# EAGLE design dmxbox (EAGLE 9.6.2)
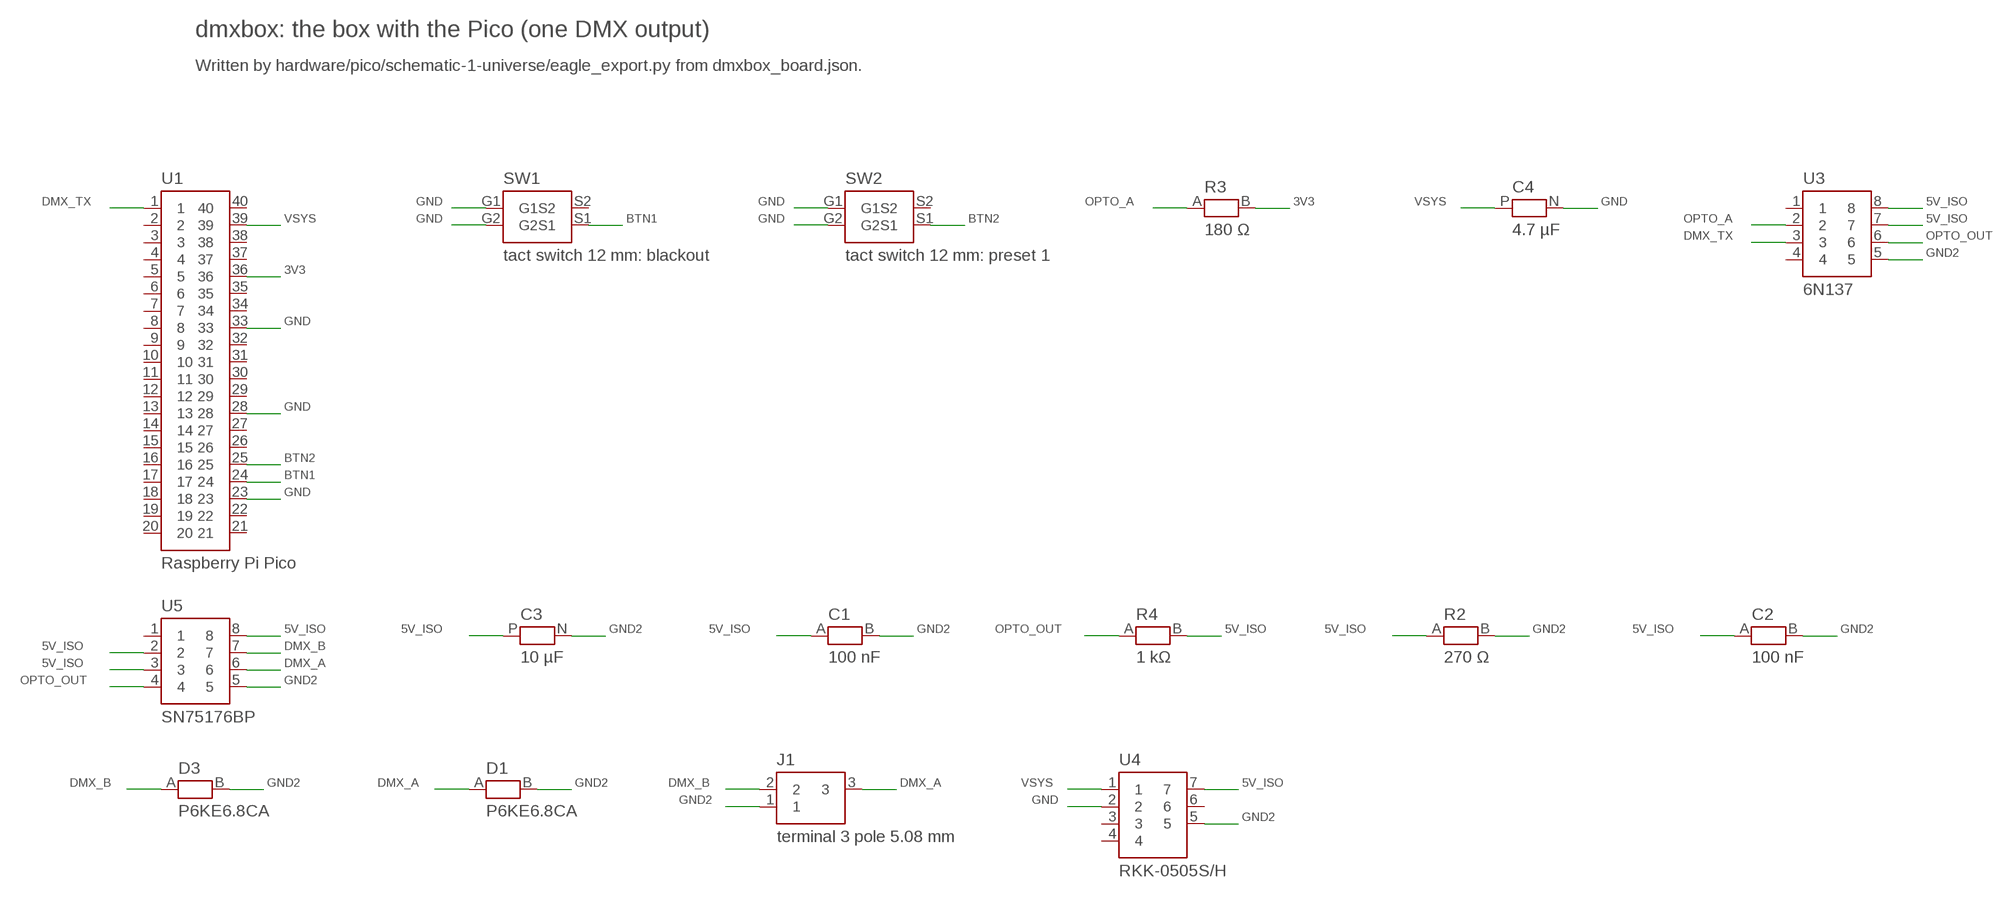
[diagram p0: schematic, sheet 1]

## Parts
C1  100 nF  C_5.00  [C_5.00]
C2  100 nF  C_5.00  [C_5.00]
C3  10 µF  CP_2.00  [CP_2.00]
C4  4.7 µF  CP_2.00  [CP_2.00]
D1  P6KE6.8CA  DO15_10.16  [DO15_10.16]
D3  P6KE6.8CA  DO15_10.16  [DO15_10.16]
J1  terminal 3 pole 5.08 mm  TERMINAL_3  [TERMINAL_3]
R2  270 Ω  R_10.16  [R_10.16]
R3  180 Ω  R_10.16  [R_10.16]
R4  1 kΩ  R_10.16  [R_10.16]
SW1  tact switch 12 mm: blackout  BUTTON_12MM  [BUTTON_12MM]
SW2  tact switch 12 mm: preset 1  BUTTON_12MM  [BUTTON_12MM]
U1  Raspberry Pi Pico  PICO  [PICO]
U3  6N137  [6N137]
U4  RKK-0505S/H  RKK_SIP7  [RKK_SIP7]
U5  SN75176BP  SN75176  [SN75176]

## Nets
3V3: R3.B U1.36
5V_ISO: C1.A C2.A C3.P R2.A R4.B U3.7 U3.8 U4.7 U5.2 U5.3 U5.8
BTN1: SW1.S1 U1.24
BTN2: SW2.S1 U1.25
DMX_A: D1.A J1.3 U5.6
DMX_B: D3.A J1.2 U5.7
DMX_TX: U1.1 U3.3
GND: C4.N SW1.G1 SW1.G2 SW2.G1 SW2.G2 U1.23 U1.28 U1.33 U4.2
GND2: C1.B C2.B C3.N D1.B D3.B J1.1 R2.B U3.5 U4.5 U5.5
OPTO_A: R3.A U3.2
OPTO_OUT: R4.A U3.6 U5.4
VSYS: C4.P U1.39 U4.1
Unconnected: SW1.S2 SW2.S2 U1.2 U1.3 U1.4 U1.5 U1.6 U1.7 U1.8 U1.9 U1.10 U1.11 U1.12 U1.13 U1.14 U1.15 U1.16 U1.17 U1.18 U1.19 U1.20 U1.21 U1.22 U1.26 U1.27 U1.29 U1.30 U1.31 U1.32 U1.34 U1.35 U1.37 U1.38 U1.40 U3.1 U3.4 U4.3 U4.4 U4.6 U5.1

## Notes on the sheet
- dmxbox: the box with the Pico (one DMX output)
- Written by hardware/pico/schematic-1-universe/eagle_export.py from dmxbox_board.json.

## Library data of the parts
C1 C2 = lumenet:C_5.00
C3 C4 = lumenet:CP_2.00
D1 D3 = lumenet:DO15_10.16
J1 = lumenet:TERMINAL_3
R2-R4 = lumenet:R_10.16
SW1 SW2 = lumenet:BUTTON_12MM
U1 = lumenet:PICO
U3 = lumenet:6N137
U4 = lumenet:RKK_SIP7
U5 = lumenet:SN75176

## Board
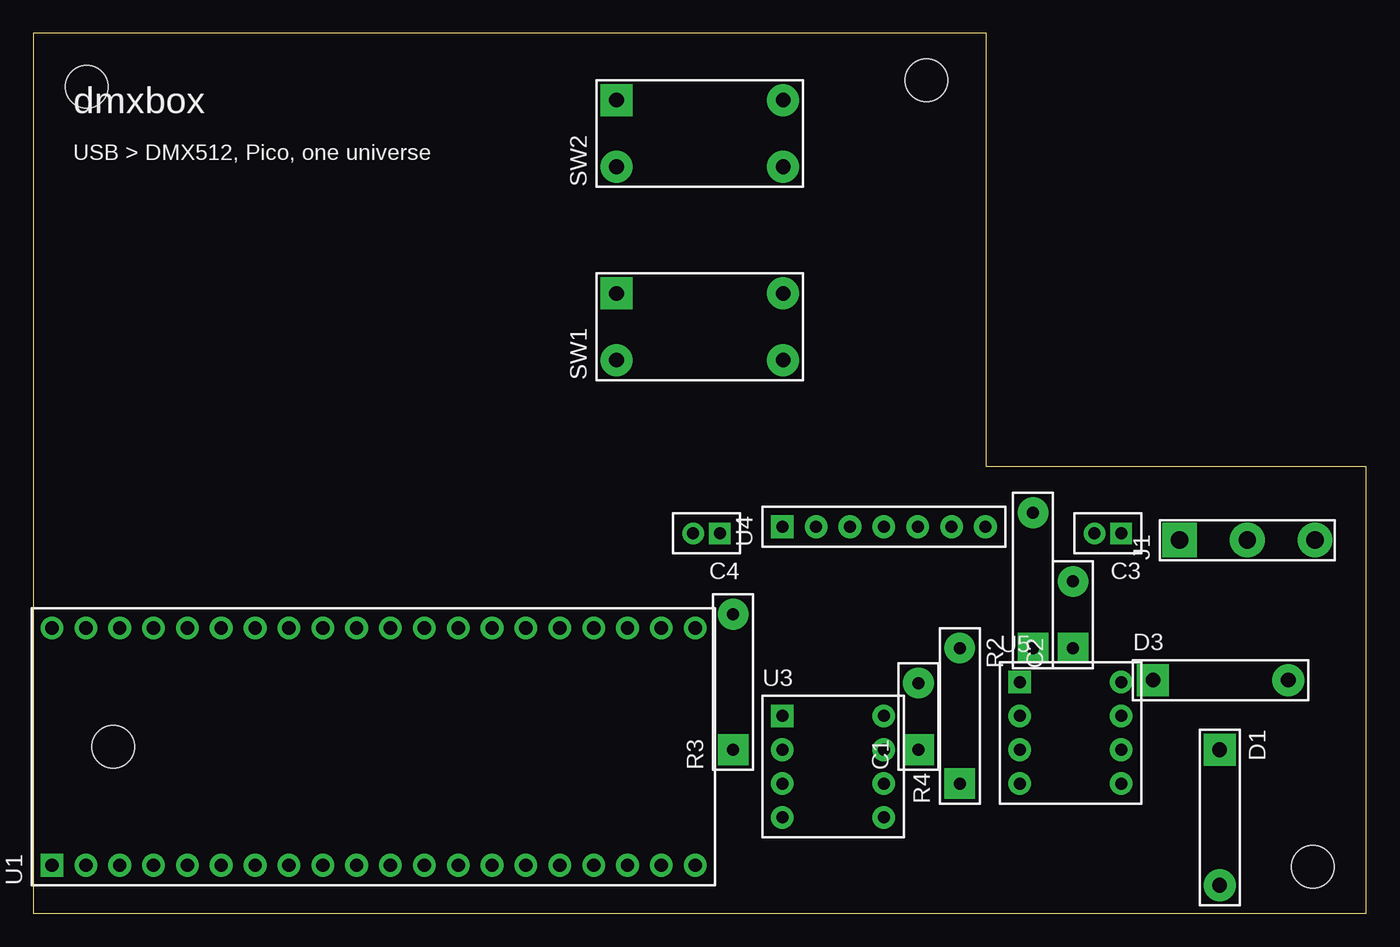
[diagram p1: board, top side]
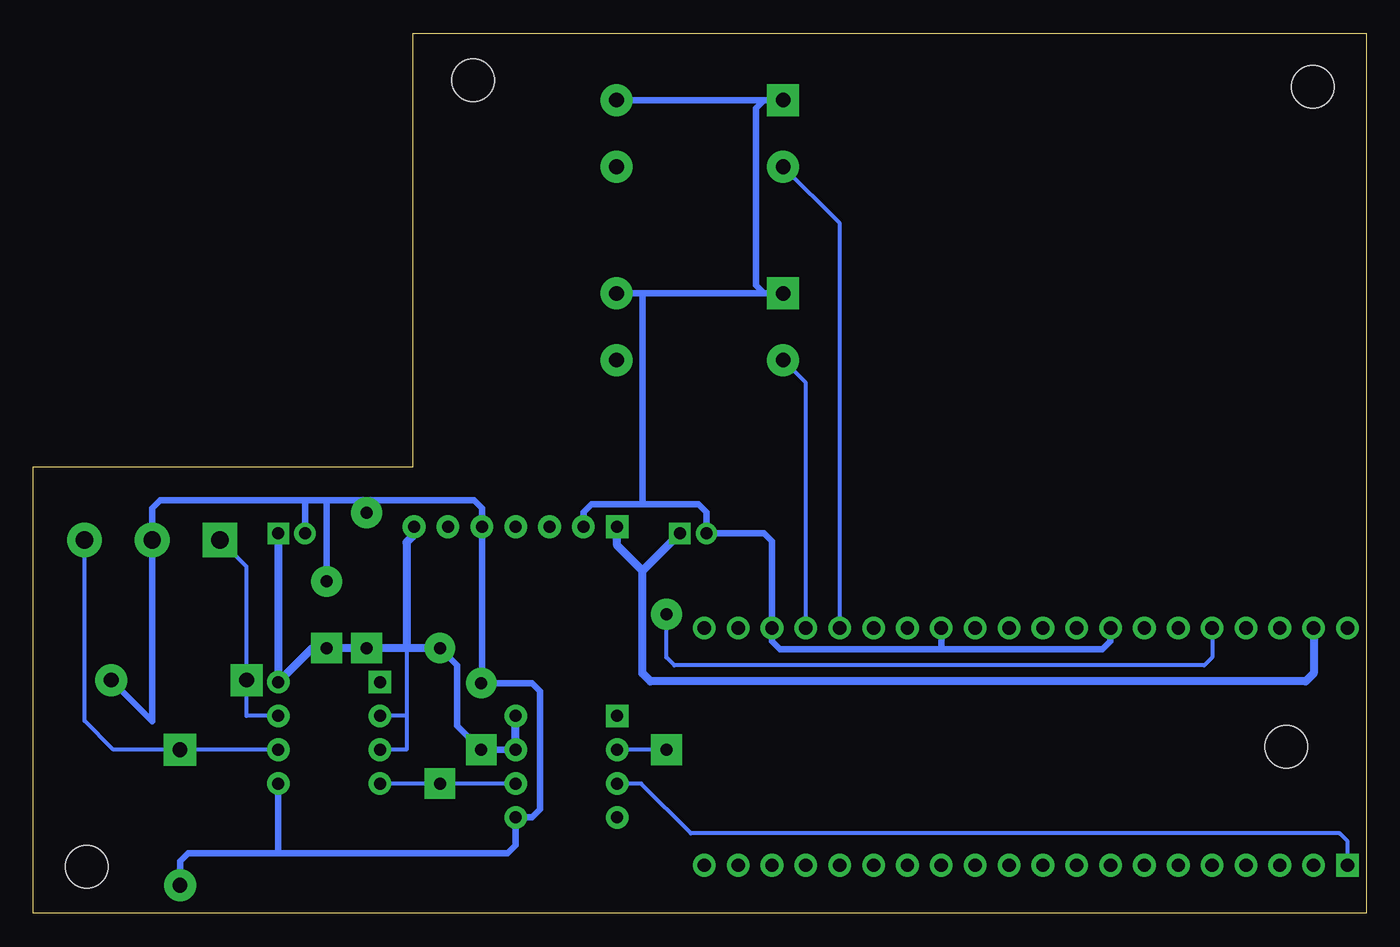
[diagram p2: board, bottom side, seen from below]

Size 100 x 66 mm. Coordinates in mm from the lower left corner, seen from the top.
Outline: 0,0 100,0 100,33.5 71.5,33.5 71.5,66 0,66 0,0
Copper layers used: Bottom
Holes 3.2 mm at 6,12.5 4,62 67,62.5 96,3.5

### Footprints (pad centres in the part's own frame; a part is rotated, then mirrored left to right if it is on the bottom)
C_5.00 = drill 0.9 pad 2.3 square: A 0,0 | drill 0.9 pad 2.3 round: B 5,0
CP_2.00 = drill 0.9 pad 1.6 round: N 2,0 | drill 0.9 pad 1.6 square: P 0,0
DO15_10.16 = drill 1.1 pad 2.4 square: A 0,0 | drill 1.1 pad 2.4 round: B 10.16,0
TERMINAL_3 = drill 1.3 pad 2.6 round: 1 0,-5.08; 3 0,-10.16 | drill 1.3 pad 2.6 square: 2 0,0
R_10.16 = drill 0.9 pad 2.3 square: A 0,0 | drill 0.9 pad 2.3 round: B 10.16,0
BUTTON_12MM = drill 1.1 pad 2.4 square: G1 0,0 | drill 1.1 pad 2.4 round: G2 0,-12.5; S1 -5,0; S2 -5,-12.5
PICO = drill 1 pad 1.7 square: 1 0,0 | drill 1 pad 1.7 round: 2 0,-2.54; 3 0,-5.08; 4 0,-7.62; 5 0,-10.16; 6 0,-12.7; 7 0,-15.24; 8 0,-17.78; 9 0,-20.32; 10 0,-22.86; 11 0,-25.4; 12 0,-27.94; 13 0,-30.48; 14 0,-33.02; 15 0,-35.56; 16 0,-38.1; 17 0,-40.64; 18 0,-43.18; 19 0,-45.72; 20 0,-48.26; 21 17.78,-48.26; 22 17.78,-45.72; 23 17.78,-43.18; 24 17.78,-40.64; 25 17.78,-38.1; 26 17.78,-35.56; 27 17.78,-33.02; 28 17.78,-30.48; 29 17.78,-27.94; 30 17.78,-25.4; 31 17.78,-22.86; 32 17.78,-20.32; 33 17.78,-17.78; 34 17.78,-15.24; 35 17.78,-12.7; 36 17.78,-10.16; 37 17.78,-7.62; 38 17.78,-5.08; 39 17.78,-2.54; 40 17.78,0
6N137 = drill 0.9 pad 1.7 square: 1 0,0 | drill 0.9 pad 1.7 round: 2 0,-2.54; 3 0,-5.08; 4 0,-7.62; 5 7.62,-7.62; 6 7.62,-5.08; 7 7.62,-2.54; 8 7.62,0
RKK_SIP7 = drill 0.9 pad 1.7 square: 1 0,0 | drill 0.9 pad 1.7 round: 2 0,-2.54; 3 0,-5.08; 4 0,-7.62; 5 0,-10.16; 6 0,-12.7; 7 0,-15.24
SN75176 = drill 0.9 pad 1.7 square: 1 0,0 | drill 0.9 pad 1.7 round: 2 0,-2.54; 3 0,-5.08; 4 0,-7.62; 5 7.62,-7.62; 6 7.62,-5.08; 7 7.62,-2.54; 8 7.62,0

### Placement (x,y rotation side)
C1  66.4,12.27 90 top
C2  78,19.89 90 top
C3  81.62,28.5 180 top
C4  51.5,28.5 180 top
D1  89,12.27 270 top
D3  84,17.5 0 top
J1  86,28 90 top
R2  75,19.89 90 top
R3  52.5,12.27 90 top
R4  69.5,9.73 90 top
SW1  43.75,46.5 90 top
SW2  43.75,61 90 top
U1  1.4,3.61 90 top
U3  56.19,14.81 0 top
U4  56.19,29 90 top
U5  74,17.35 0 top

### Tracks (layer width: path | path; a pad name or v marks a point on that pad's centre or on a via)
3V3
  Bottom 0.3: U1.36 11.56,19.2 12.16,18.6 51.9,18.6 52.5,19.2 R3.B
5V_ISO
  Bottom 0.3: 72,19.89 72,14.81 | 72,14.81 72,12.27 U5.3 | 72,14.81 U5.2
  Bottom 0.5: R4.B 68.2,18.59 68.2,14.07 C1.A U3.7
  Bottom 0.6: U4.7 71.43,28.4 72,27.83 72,19.89 | R4.B 72,19.89 | 72,19.89 R2.A C2.A 79.08,19.89 U5.8 C3.P | U3.7 U3.8
BTN1
  Bottom 0.3: U1.24 42.04,39.79 SW1.S1
BTN2
  Bottom 0.3: U1.25 39.5,51.75 SW2.S1
DMX_A
  Bottom 0.3: U5.6 D1.A 94,12.27 96.16,14.43 J1.3
DMX_B
  Bottom 0.3: U5.7 84,14.81 D3.A 84,26 J1.2
DMX_TX
  Bottom 0.3: U1.1 1.4,5.4 2,6 50.67,6 54.4,9.73 U3.3
GND
  Bottom 0.5: U1.33 19.18,20.4 19.78,19.8 43.98,19.8 44.58,20.4 U1.23 44.58,27.9 45.18,28.5 C4.N 49.5,30.1 50.1,30.7 54.3,30.7 | 31.88,19.8 U1.28 | 54.3,30.7 58.13,30.7 58.73,30.1 U4.2 | 54.3,46.5 54.3,30.7 | SW1.G1 45.2,46.5 | 45.2,46.5 54.3,46.5 | 54.3,46.5 SW1.G2 | 45.2,46.5 45.8,47.1 45.8,60.4 45.2,61 | SW2.G1 SW2.G2
GND2
  Bottom 0.5: 75,31 66.95,31 66.35,30.4 U4.5 66.35,17.32 C1.B 62.6,17.27 62,16.67 62,7.79 62.6,7.19 U3.5 63.81,5.1 64.41,4.5 81.62,4.5 | 75,31 78,31 | 78,31 79.62,31 | 79.62,31 90.48,31 91.08,30.4 J1.1 91.08,14.42 D3.B | 79.62,31 C3.N | 75,31 R2.B | 78,31 C2.B | 81.62,4.5 88.4,4.5 89,3.9 D1.B | 81.62,4.5 U5.5
OPTO_A
  Bottom 0.3: R3.A U3.2
OPTO_OUT
  Bottom 0.3: U3.6 R4.A U5.4
VSYS
  Bottom 0.6: U1.39 3.94,18 4.54,17.4 53.7,17.4 54.3,18 54.3,25.7 | 54.3,25.7 56.19,27.59 U4.1 | 54.3,25.7 C4.P

### Text on the board
tPlace: dmxbox | USB > DMX512, Pico, one universe